# Altium schematic sheet Load7.SchDoc
size A4; SheetNumber: 10; SheetTotal: 15
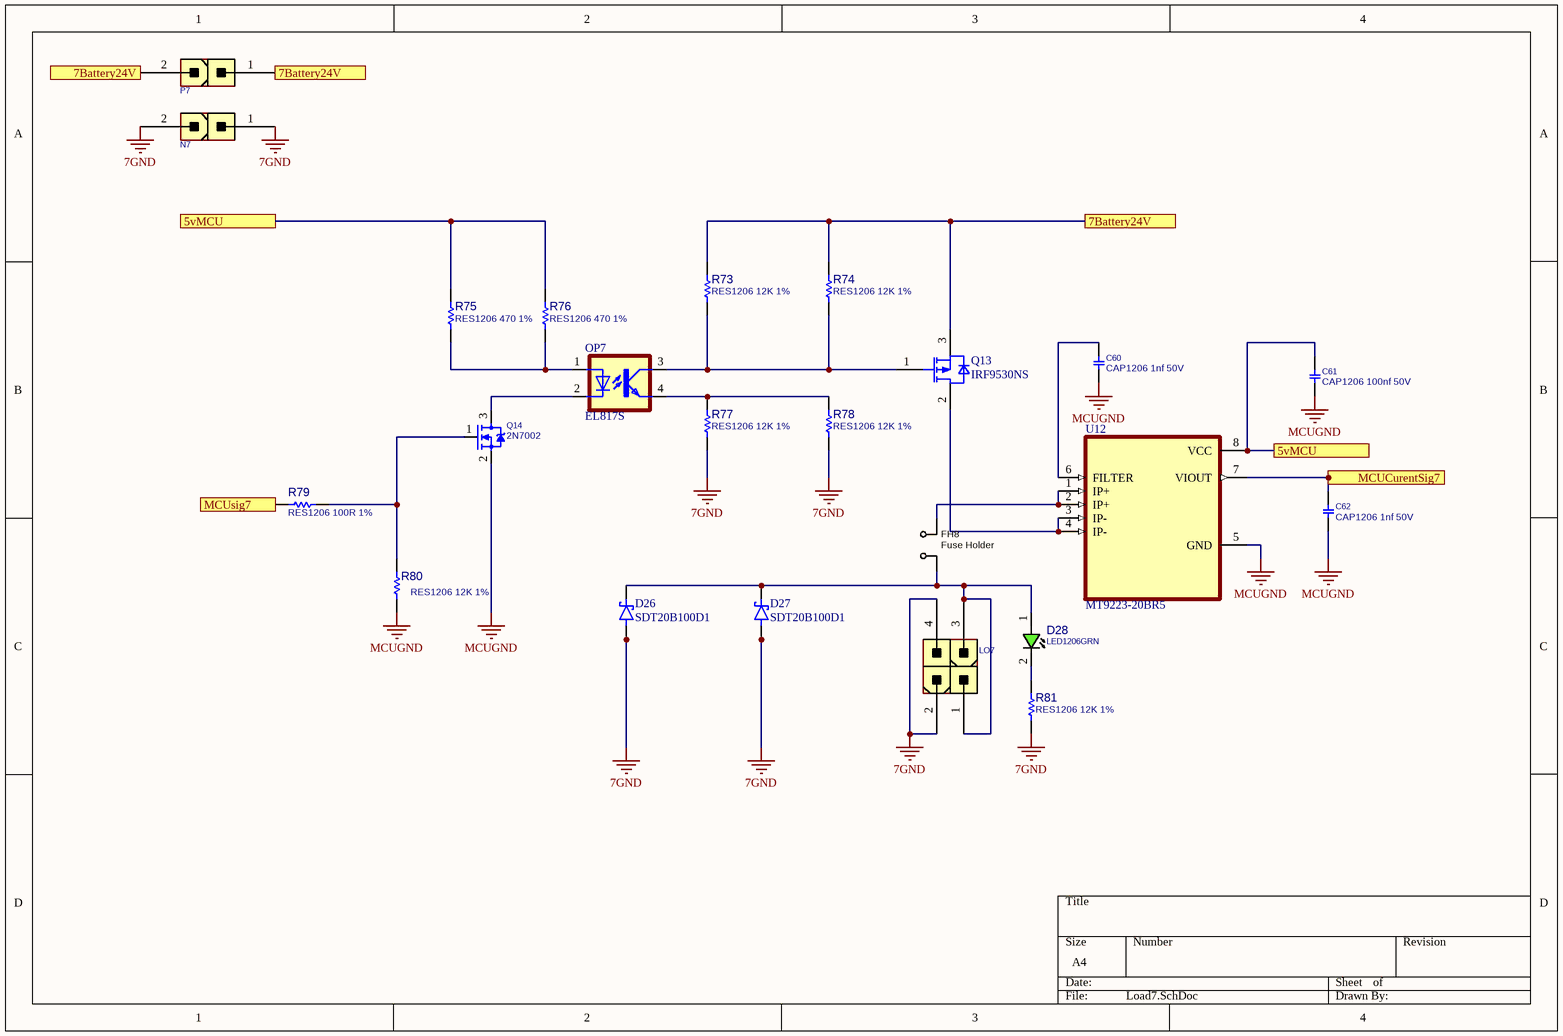
[diagram p0: Load7.SchDoc]

## Parts
C60  CAP1206 1nf 50V  [C1206]
C61  CAP1206 100nf 50V  [C1206]
C62  CAP1206 1nf 50V  [C1206]
D26  SDT20B100D1  [DPAK229P990X238-3N]
D27  SDT20B100D1  [DPAK229P990X238-3N]
D28  LED1206GRN  [LED1206GRN]
FH8  Fuse Holder  [FH_24101812]
LO7  CONN_ATXPWR_4  [ATXPWR_4]  (value not drawn)
N7  CONN_ATXPWR_2  [ATXPWR_2]  (value not drawn)
OP7  EL817S  [SOIC254P1030X460-4N]
P7  CONN_ATXPWR_2  [ATXPWR_2]  (value not drawn)
Q13  IRF9530NS  [TO254P1528X508-4_3N-V1]
Q14  2N7002  [SOT23_3]
R73  RES1206 12K 1%  [R1206]
R74  RES1206 12K 1%  [R1206]
R75  RES1206 470 1%  [R1206]
R76  RES1206 470 1%  [R1206]
R77  RES1206 12K 1%  [R1206]
R78  RES1206 12K 1%  [R1206]
R79  RES1206 100R 1%  [R1206]
R80  RES1206 12K 1%  [R1206]
R81  RES1206 12K 1%  [R1206]
U12  MT9223-20BR5  [SOIC127P600X175-8N]

## Ports
5vMCU, 7Battery24V, MCUCurentSig7, MCUsig7

## Nets
7GND: D26.1(A) D26.3(A__1) D27.1(A) D27.3(A__1) LO7.2 LO7.4 N7.1 N7.2 R77.2 R78.2 R81.2
MCUGND: C60.2 C61.2 C62.2 Q14.2(SOURCE) R80.2 U12.5(GND)
5vMCU: C61.1 R75.2 R76.2 U12.8(VCC) ; port 5vMCU
7Battery24V: P7.1 P7.2 Q13.3(SOURCE) R73.1 R74.1 ; port 7Battery24V
MCUCurentSig7: C62.1 U12.7(VIOUT) ; port MCUCurentSig7
MCUsig7: R79.1 ; port MCUsig7
NetC60_1: C60.1 U12.6(FILTER)
NetD26_4: D26.4(K) D27.4(K) D28.1(ANODE) FH8.1 LO7.1 LO7.3
NetD28_2: D28.2(CATHODE) R81.1
NetFH8_2: FH8.2 U12.1(IP+) U12.2(IP+)
NetOP7_1: OP7.1(A) R75.1 R76.1
NetOP7_2: OP7.2(C) Q14.3(DRAIN)
NetOP7_3: OP7.3(COL) Q13.1(GATE) R73.2 R74.2
NetOP7_4: OP7.4(EMIT) R77.1 R78.1
NetQ13_2: Q13.2(DRAIN) U12.3(IP-) U12.4(IP-)
NetQ14_1: Q14.1(GATE) R79.2 R80.1

## Library data of the parts
C60-C62 = CAP_SMD_MLCC_1206: CAP, MLCC; PARAM: -, -%; MANF_P#: MANF_PART#; PARAM2: -V; PRICE: 100= 1$; MANF: -; ASSEMBLY: ASSEMBLY
D26 D27 = MBRD835L: Diode Schottky 35 V 8A Surface Mount DPAK; MF: ON Semiconductor; SnapEDA_Link: https://www.snapeda.com/parts/MBRD835L/Onsemi/view-part/?ref=snap; Package: TO-252-3 MICROSS/On Semiconductor; Value: *; MP: MBRD835L; Check_prices: https://www.snapeda.com/parts/MBRD835L/Onsemi/view-part/?ref=eda
D28 = LED_SMD_1206_GRN: LED, SMD, 1206, GREEN; PARAM: 20mA; DESC: DESCRIPTION; PARAM2: 2.2V; MANF: -; ASSEMBLY: ASSEMBLY; PRICE: 36t@Javan; MANF_P#: -; VALUE: LED1206GRN; MountType: SMT; PartType: LED
FH8 = FUSE_SMD_HOLDER_24101812: Fuse SMD2410 Holder; PARAM: max. 10A; MANF: Littelfuse; MANF_P#: 01550900M; PARAM2: 125v; PRICE: 0.2$; PACKAGE: SMD,5.0x9.7mm; VALUE: Fuse Holder
LO7 = CONN_ATXPWR_4: CONN, ATX POWER, 4 P; MANF: TE, Molex; MANF_P#: 4-1775099-0, 39281043; VALUE: CONN_ATXPWR_4; MountType: THD; PACKAGE: ATXPWR-4pin; Part Type: Conn.
N7 P7 = CONN_ATXPWR_2: CONN, ATX POWER, 2 P; MANF: Molex; MANF_P#: 39281023; VALUE: CONN_ATXPWR_2; MountType: THD; PACKAGE: ATXPWR-2pin; Part Type: Conn.
OP7 = EL817S: Optoisolator Transistor Output 5000Vrms 1 Channel 4-SMD; MF: Everlight Electronics; SnapEDA_Link: https://www.snapeda.com/parts/EL817S/Everlight+Electronics+Co+Ltd/view-part/?ref=snap; Package: SMD-4 Everlight Electronics Co Ltd; Value: *; MP: EL817S; Check_prices: https://www.snapeda.com/parts/EL817S/Everlight+Electronics+Co+Ltd/view-part/?ref=eda
Q13 = IRF9530NS: OptiMOS - P2 Power-Transistor, P-channel-Enhancement mode, VDS -30V; Manufacturer: Infineon Technologies; Manufacturer Order NumberManufacturer Order Number: IRF9530NS; PackageReference: PG-TO263-3-901
Q14 = MOSN_2N7002_SOT23: MOSFET, N-CH, 60V, 0.3A; MANF: NXP; ASSEMBLY: ASSEMBLY; MANF_P#: 2N7002; PARAM2: 60v; PARAM: 0.3A; PRICE: 0.3t@Javan; VALUE: 2N7002
R73-R81 = RES_SMD_1206: RESISTOR, SMD; PARAM: 1%, 0.25W; DESC: DESCRIPTION; DIST#: MOUSER; MANF_P#: -; MANF: -; ASSEMBLY: ASSEMBLY; PRICE: -; PARAM2: -
U12 = ACS712ELCTR-05B-T: MF: {'manufacturer': u'Allegro MicroSystems'}; Package: None; Price: None; Value: *; MP: ACS712ELCTR-05B-T; Availability: Unavailable